# Altium project 0251003.NRT1L.PrjPcb
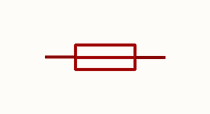
[diagram p0: 0251003.NRT1L.schdoc]
1 sheet, 1 parts. Net scope: global (net labels, ports and power ports of the same name join across sheets).

## Sheet 0251003.NRT1L.schdoc
size 127 x 101 mm

### Parts
U?  0251003.nrt1l  [FUSE-TH_BD3.0-L7.2-P11.20-D0.6]  (value not drawn)

### Nets

Not connected (* = marked no-connect by the designer): U? 1 2

### Library data of the parts
U? = 0251003.nrt1l: 类型:电阻式保险丝;额定电流:3A;额定电压:125V;分断能力:50A；300A;; Manufacturer: Littelfuse(美国力特); AddInBom: yes; ModelId: 8493180d87ef424b8637a2753ca991c6; ModelName: FUSE-TH_BD3.4-L7.1-P11.20-D0.6; ModelTransform: 497.6368,134.6891,0,0,0,0,0,0,-196.85; Current Rating: 3A; Voltage Rating (DC): 125V; Melting I2t: 1.19; Symbol: 0251003.NRT1L; LCSC Part Name: 插件式保险丝; SupplierPart: C178928; ManufacturerPart: 0251003.NRT1L; Supplier Footprint: 插件,D2.8xL7.1mm; JLCPCB Part Class: Extended Part; Datasheet: https://item.szlcsc.com/datasheet/0251003.NRT1L/190321.html; Supplier: LCSC; ConvertToPcb: yes; FootprintName: FUSE-TH_BD3.0-L7.2-P11.20-D0.6; Type: 电阻式保险丝; Operating Temperature: -55℃~+125℃; Interrupt Rating: 50A；300A; Diameter (φD): 2.8mm; Length: 7.1mm